# EAGLE schematic Esquema Control (EAGLE 9.7.0)
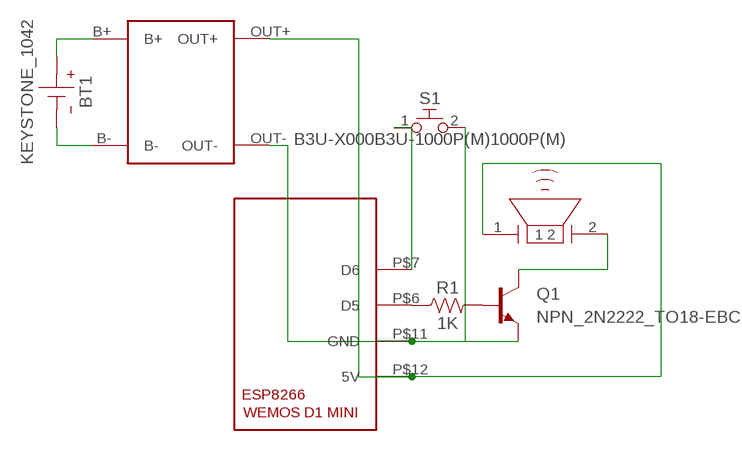
[diagram p0: schematic, sheet 1]

## Parts
BT1  KEYSTONE_1042  [1042]
LS1  PIEZO  [PIEZO]
Q1  NPN_2N2222_TO18-EBC  [TO18]
R1  1K  R-US_CHIP-0402(1005-METRIC)  [RESC1005X40]
S1  B3U-X000B3U-1000P(M)1000P(M)  [B3U-1000PM]
U1  WEMOS_D1_MINIWEMOS_D1_MINI  [WEMOS_D1_MINI]
UPS18650V3-SKU672  MODULO_CARGADOR_18650MODULO_CARGADOR_18650  [MODULO_CARGADOR_18650]

## Nets
+: BT1.P(+) UPS18650V3-SKU672.B+
-: BT1.N(-) UPS18650V3-SKU672.B-
N$1: S1.1 U1.P$7(D6)
N$2: Q1.2(B) R1.2
N$3: Q1.1(E) S1.2 U1.P$11(GND) UPS18650V3-SKU672.OUT-
N$4: R1.1 U1.P$6(D5)
N$5: LS1.1 U1.P$12(5V) UPS18650V3-SKU672.OUT+
N$6: LS1.2 Q1.3(C)

## Library data of the parts
BT1 = Battery_Holder:KEYSTONE_?: Keystone’s Single Cell Battery Holders
LS1 = Tinkercad:PIEZO: Piezoelectric Sounders / Buzzers Reference Datasheet <https://www.murata.com/products/productdata/8801054621726/SPEC-PKM17EPPH4001-B0.pdf?1517839212000>
Q1 = Transistor:NPN_: NPN Transistor - Popular parts
R1 = Resistor:R-US: Resistor Fixed - ANSI
S1 = Switch:B3U-X000: Ultra-small Tactile Switch Contact form : SPST-NO Reference: Datasheet <https://omronfs.omron.com/en_US/ecb/products/pdf/en-b3u.pdf>
U1 = Test:WEMOS_D1_MINI
UPS18650V3-SKU672 = Test:MODULO_CARGADOR_18650